# EasyEDA Pro project ProProject_25电赛备赛_2025-07-07.epro, board PCB1_2
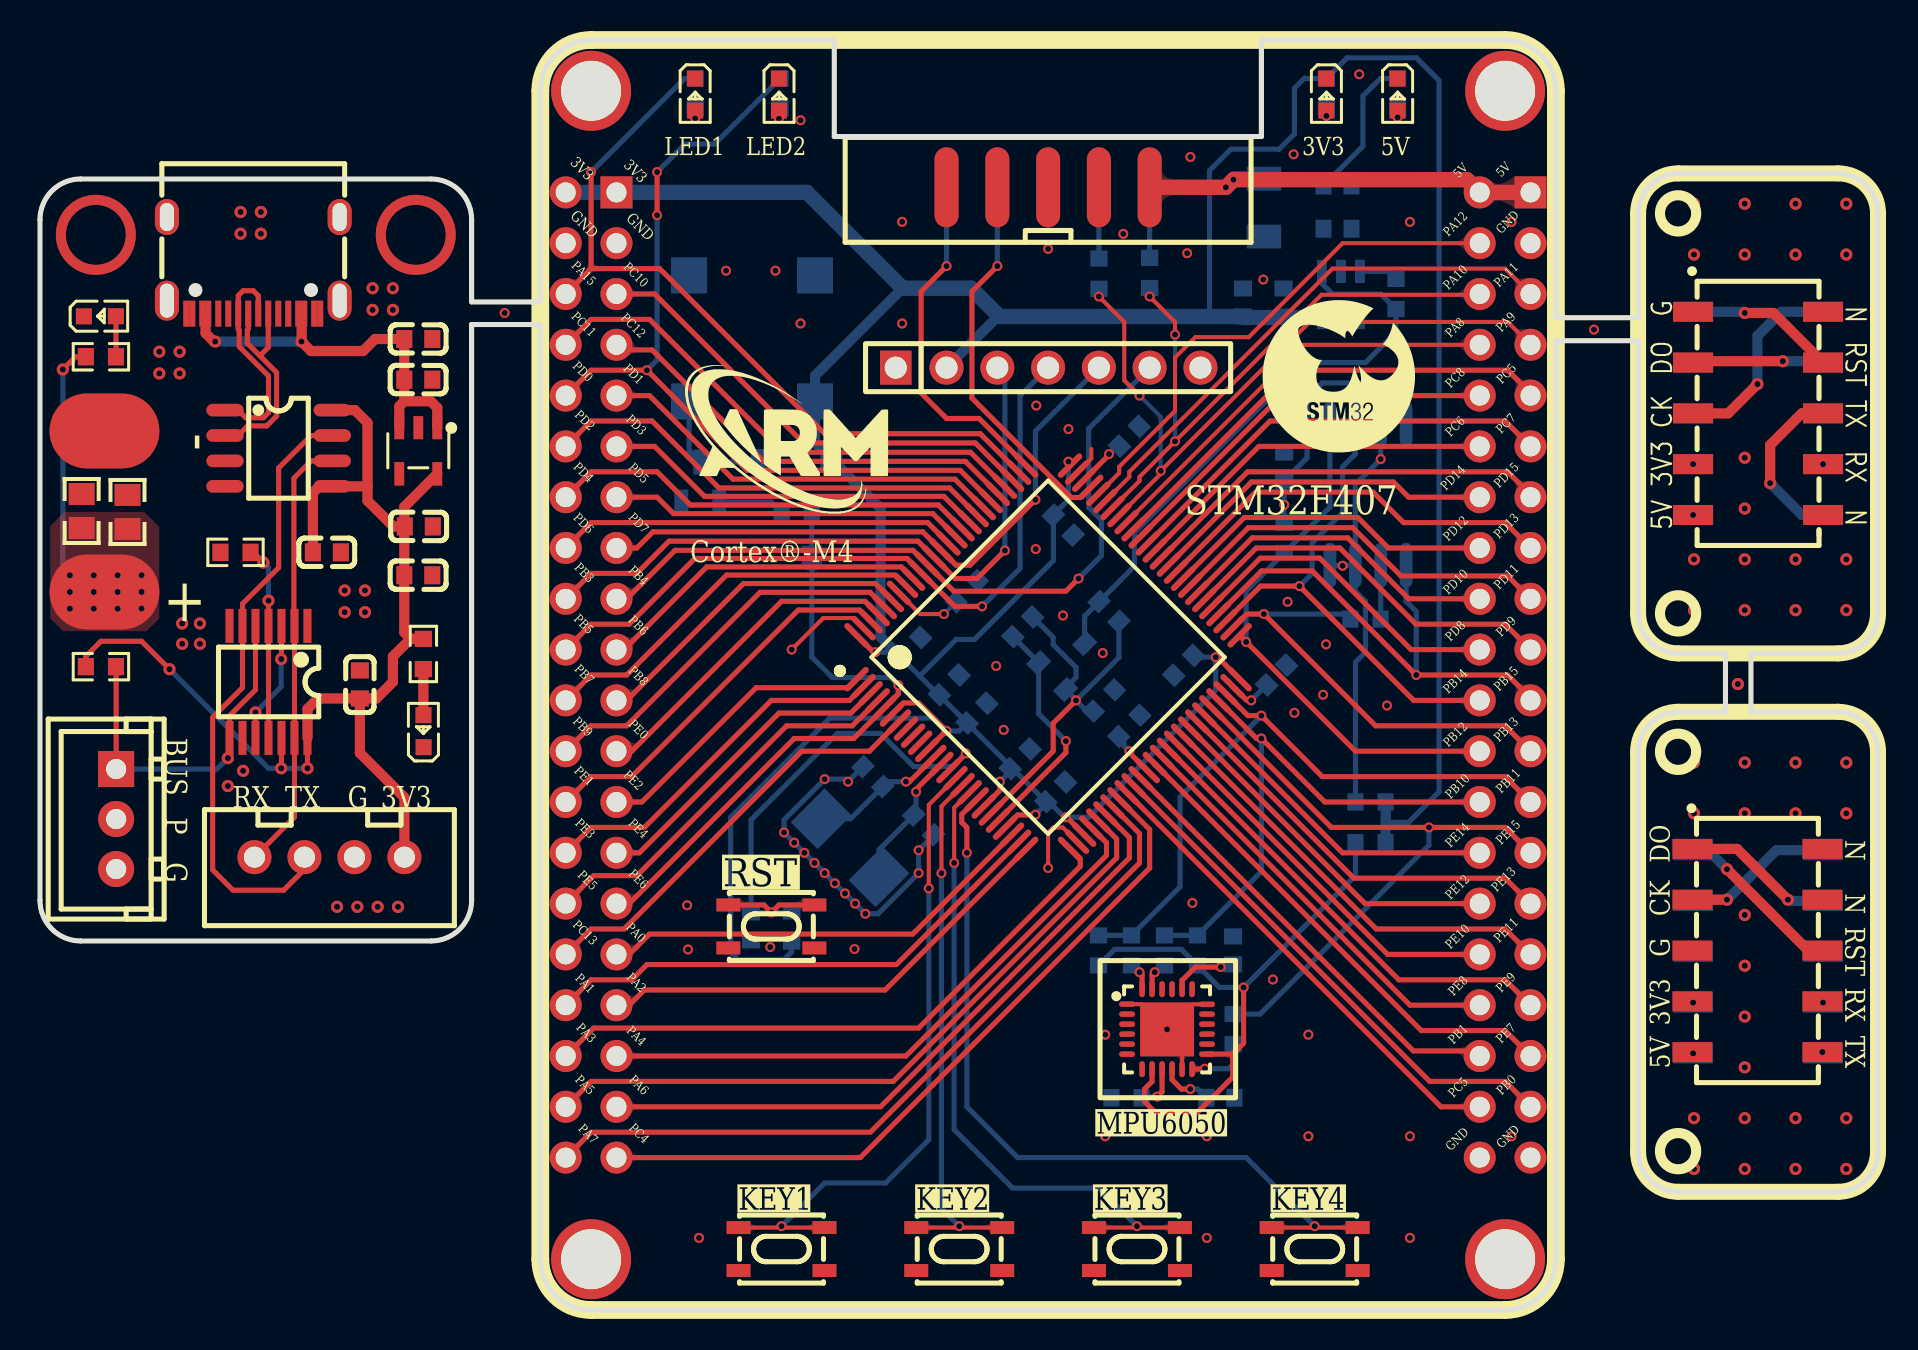
[diagram p6: board, top side]
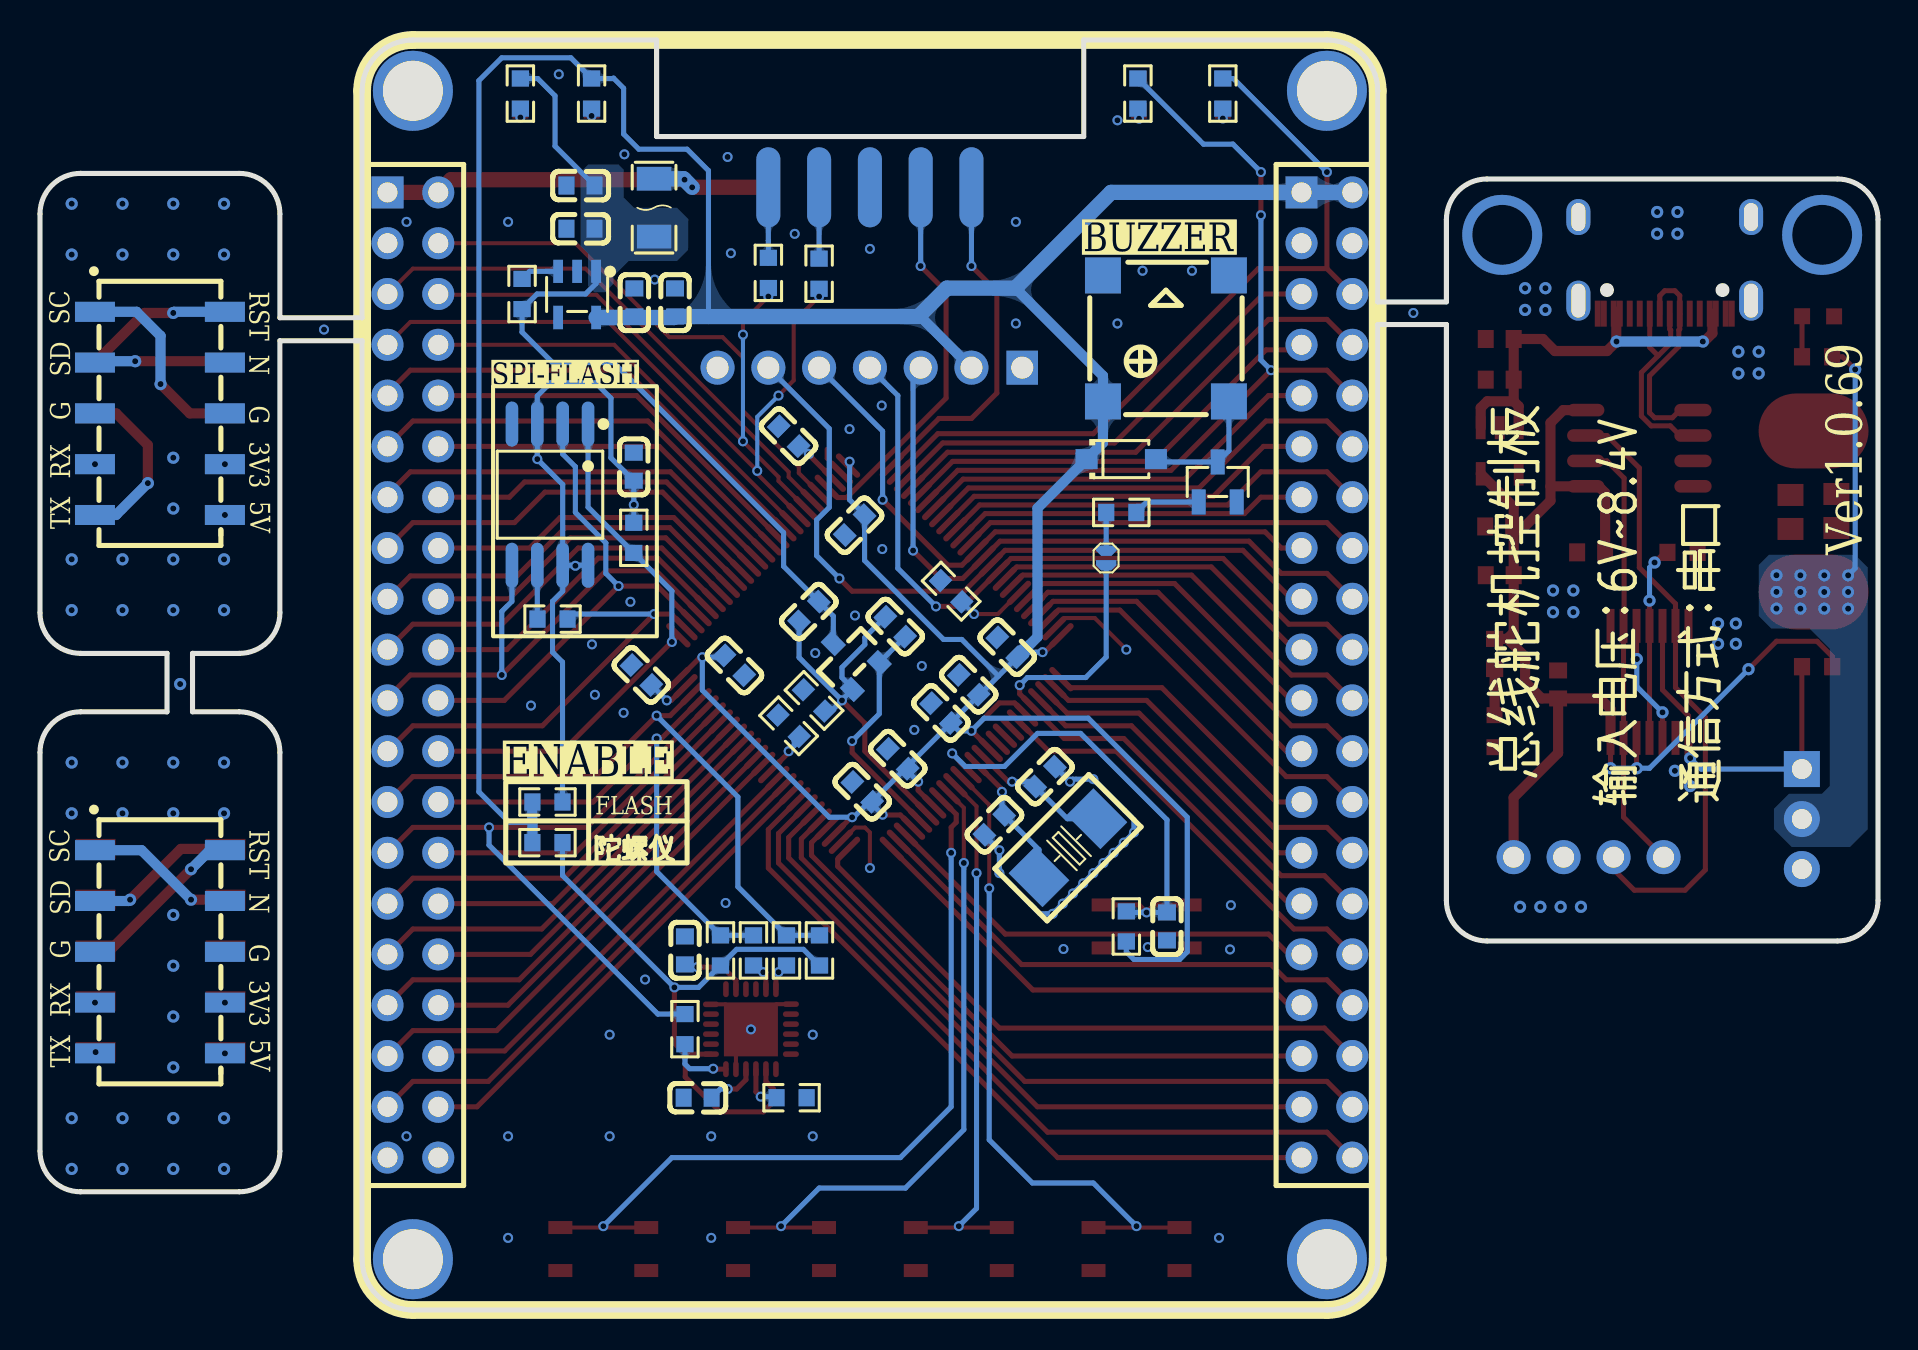
[diagram p7: board, bottom side, seen from below]

Outline 91.94 x 63.5 mm; copper layers: Top Layer, Bottom Layer. Coordinates in mm from the lower left corner of the outline.
Outline path: 0,54.52 0,20.48 arc(0.6,19.05) 2.03,18.45 19.56,18.45 arc(20.99,19.05) 21.59,20.48 21.59,49.27 25.03,49.27 25.03,2.54 arc(25.77,0.74) 27.57,0 73.29,0 arc(75.08,0.74) 75.83,2.54 75.83,48.46 79.94,48.46 79.94,34.86 arc(80.53,33.43) 81.97,32.83 84.31,32.83 84.31,29.91 81.97,29.91 arc(80.53,29.31) 79.94,27.88 79.94,7.94 arc(80.53,6.51) 81.97,5.91 89.91,5.91 arc(91.34,6.51) 91.94,7.94 91.94,27.88 arc(91.34,29.31) 89.91,29.91 85.58,29.91 85.58,32.83 89.91,32.83 arc(91.34,33.43) 91.94,34.86 91.94,54.8 arc(91.34,56.24) 89.91,56.83 81.97,56.83 arc(80.53,56.24) 79.94,54.8 79.94,49.61 75.83,49.61 75.83,60.96 arc(75.08,62.76) 73.29,63.5 61.09,63.5 61.09,58.67 39.73,58.67 39.73,63.5 27.57,63.5 arc(25.77,62.76) 25.03,60.96 25.03,50.4 21.59,50.4 21.59,54.52 arc(20.99,55.96) 19.56,56.55 2.03,56.55 arc(0.6,55.96) 0,54.52
Stack: Top Layer 0.035mm - / Dielectric1 1.51mm FR4 er 4.5 / Bottom Layer 0.035mm -

## Design rules (mm)
net OSC_OUT: DP4
net OSC_IN: DP4
net OSC32_IN: DP3
net OSC32_OUT: DP3
template: 自定义配置
spacing copperThickness1oz (default): track to track 0.102, other pairs 0.152 to 0.3
spacing copperThickness2oz: track to track 0.203, other pairs 0.152 to 0.3
track width copperThickness1oz (default): min 0.127, default 0.254, max 2.54
track width copperThickness2oz: min 0.203, default 0.254, max 2.54
differential pair differentialPair (default): width min 0.127, default 0.254, max 2.54; gap min 0.152, default 0.152
via viaSize (default): diameter min 0.399, default 0.5, max 10; hole min 0.3, default 0.3, max 6.299

## Placement (name value [footprint] x y rotation side)
BUZZER1  SMD-7525  [BUZ-SMD_4P-L7.5-W7.5-BR]  35.62 48.58 270 bottom
C17  100nF  [C0603]  62.24 42.16 90 bottom
C19  -  [capc2012[0805]s-n]  4.38 39.9 270 top
C19#2  -  [C0603]  64.9 56.22 0 bottom
C20  -  [capc2012[0805]s-n]  2.08 39.95 270 top
C20#2  -  [C0603]  64.9 54.06 0 bottom
C21  1uF  [C0603]  62.21 50.38 90 bottom
C22  10nF  [C0603]  60.17 50.38 90 bottom
C25  100nF  [C0603]  18.92 46.52 0 top
C26  1uF  [C0603]  18.95 39.18 0 top
C43  100nF  [C0603]  16 31.28 90 top
C44  100nF  [C0603]  14.35 37.88 0 top
C45  1uF  [C0603]  18.92 48.55 0 top
C46  100nF  [C0603]  18.92 36.74 0 top
CN1  XH2.54-3A  [CONN-TH_3P-P2.50_HCTL_XH-3A-L]  3.81 24.55 90 top
D2  1N4148W  [SOD-123F_L2.7-W1.6-LS3.8-RD]  37.85 42.55 180 bottom
H1  -  [HDR-TH_7P-P2.54-V-F]  50.43 47.12 0 top
LED1  -  [LED_0603]  19.18 28.99 90 top
LED2  -  [LED_0603]  3.05 49.69 0 top
LED2#2  -  [LED_0603]  64.35 60.72 270 top
LED5  -  [LED_0603]  67.91 60.72 270 top
LED8  -  [LED_0603]  32.77 60.72 270 top
LED9  -  [LED_0603]  36.97 60.72 270 top
NOREF  -  [Pad_e112]  73.29 60.96 0 top
NOREF#2  -  [Pad_e923]  27.57 60.96 0 top
NOREF#3  -  [Pad_e925]  73.29 2.54 0 top
NOREF#4  -  [Pad_e924]  27.57 2.54 0 top
P1  2.54-2*5P简牛  [简牛2*5-2.54]  50.43 56.13 0 top
P5  WirePad  [WirePad-4x6]  3.22 43.95 180 top
P6  WirePad  [WirePad-4x6]  3.22 35.9 180 top
Q3  SS8050  [SOT-23-3_L2.9-W1.3-P1.90-LS2.4-BR]  33.03 41.4 270 bottom
R1  10K  [R0603]  3.05 32.17 0 top
R2  10K  [R0603]  9.78 37.88 180 top
R3  -  [R0603]  19.18 32.8 270 top
R3#2  -  [R0603]  37.6 19.18 270 bottom
R4  -  [R0603]  3.05 47.66 0 top
R4#2  -  [R0603]  52.97 51.82 90 bottom
R5  20Ω  [R0603]  55.5 51.85 90 bottom
R8  180  [R0603]  37.85 39.88 180 bottom
R12  10K  [R0603]  67.83 50.8 270 bottom
R16  10K  [R0603]  46.36 35.94 45 bottom
R17  0  [R0603]  53.22 30.48 45 bottom
R22  10K  [R0603]  54.49 29.21 45 bottom
R27  10K  [R0603]  52.95 17.98 270 bottom
R28  10K  [R0603]  57.9 17.98 270 bottom
R29  120R  [R0603]  54.6 17.98 90 bottom
R30  120R  [R0603]  56.25 17.98 90 bottom
R31  120R  [R0603]  59.68 14.04 270 bottom
R32  10K  [R0603]  54.35 10.61 0 bottom
R44  22  [R0603]  66.3 34.54 0 bottom
R45  10K  [R0603]  62.24 38.61 90 bottom
R47  10kΩ  [R0603]  64.35 60.82 90 bottom
R50  10kΩ  [R0603]  67.91 60.82 90 bottom
R53  10kΩ  [R0603]  32.77 60.82 90 bottom
R54  10kΩ  [R0603]  37.02 60.82 90 bottom
R56  0  [R0603]  66.55 23.37 0 bottom
R57  0  [R0603]  66.55 25.4 0 bottom
RST  YTS-A016-2  [SW-SMD_4P-L4.2-W3.3-P2.15-LS4.7]  36.58 19.18 0 top
SW3  YTS-A016-2  [SW-SMD_4P-L4.2-W3.3-P2.15-LS4.7]  37.09 3.05 0 top
SW4  YTS-A016-2  [SW-SMD_4P-L4.2-W3.3-P2.15-LS4.7]  45.98 3.05 0 top
SW5  YTS-A016-2  [SW-SMD_4P-L4.2-W3.3-P2.15-LS4.7]  54.87 3.05 180 top
SW6  YTS-A016-2  [SW-SMD_4P-L4.2-W3.3-P2.15-LS4.7]  63.76 3.05 180 top
U1  -  [LQFP-100_L14.0-W14.0-P0.50-LS16.0-BL]  50.43 32.64 315 top
U1#2  -  [HDR-SMD_10P-L13.1-W6.0-P2.54-LS7.1-EH]  85.94 17.91 270 bottom
U2  -  [HDR-SMD_10P-L13.1-W6.0-P2.54-LS7.1-EH]  85.91 17.97 270 top
U2#2  -  [C0603]  41.66 26.67 135 bottom
U3  -  [SOT-23-5_L3.0-W1.7-P0.95-LS2.8-BL]  18.92 42.96 180 top
U3#2  -  [HDR-SMD_10P-L13.1-W6.0-P2.54-LS7.1-EH]  85.94 44.83 270 bottom
U3#3  -  [C0603]  44.2 24.26 315 bottom
U4  -  [HDR-SMD_10P-L13.1-W6.0-P2.54-LS7.1-EH]  85.94 44.83 270 top
U4#2  -  [SOT-23_L2.9-W1.3-P1.90-LS2.4-BR]  51.44 32.51 225 bottom
U5  -  [TSSOP-14_L5.0-W4.4-P0.65-LS6.4-BL]  11.43 31.41 180 top
U5#2  -  [C0603]  49.16 34.16 225 bottom
U6  -  [CONN-TH_4P-P2.50-XH2.54-4P]  14.48 22.64 0 top
U6#2  -  [C0603]  53.47 34.92 135 bottom
U7  1uF  [C0603]  61.86 31.75 225 bottom
U8  -  [SOP-8_L4.9-W3.9-P1.27-LS6.0-BL]  11.94 43.09 270 top
U8#2  -  [C0603]  54.49 43.69 225 bottom
U9  100nF  [C0603]  35.57 19.18 90 bottom
U16  100nF  [C0603]  49.03 27.56 225 bottom
U17  100nF  [C0603]  46.87 29.84 225 bottom
U18  100nF  [C0603]  45.48 31.26 225 bottom
U19  100nF  [C0603]  43.55 33.13 225 bottom
U20  100nF  [C0603]  51.19 39.24 135 bottom
U29  100nF  [C0603]  50.81 25.91 225 bottom
U30  100nF  [C0603]  57.2 32.23 45 bottom
U31  1.5A快恢复保险丝-1206  [F1206]  61.22 55.12 270 bottom
U32  MPU-6050  [QFN-24_L4.0-W4.0-P0.50-BL-EP2.7]  56.38 14.04 270 top
U33  100nF  [C0603]  59.04 10.61 0 bottom
U34  100nF  [C0603]  59.68 17.98 270 bottom
U36  -  [短接焊盘]  38.61 37.59 90 bottom
U37  W25Q128JVSIQ  [SOIC-8_L5.3-W5.3-P1.27-LS8.0-BL]  66.43 40.77 0 bottom
U38  2.54-2*20  [HDR-TH_40P-P2.54-V-F-R2-C20-S2.54]  73.29 31.75 270 bottom
U39  2.54-2*20  [HDR-TH_40P-P2.54-V-F-R2-C20-S2.54]  27.57 31.75 270 bottom
U40  RT9013-33GB  [SOT-23-5_L3.0-W1.7-P0.95-LS2.8-BL]  65.07 50.78 0 bottom
USB1  -  [USB_TYPE-C-16P]  10.8 52.23 180 top
X1  8MHz  [OSC-SMD_L5.0-W3.2]  40.52 23.11 135 bottom

## Footprints (pads in the part's own frame, mm; a bottom-side part is the same pattern mirrored in y, then rotated)
BUZ-SMD_4P-L7.5-W7.5-BR
  rect 1.8x1.8 smd: 1(3.15,-3.15) 2(3.15,3.15) 3(-3.15,3.15) 4(-3.15,-3.15)
C0603
  rect 0.8x0.9 smd: 1(-0.7,0) 2(0.7,0)
capc2012[0805]s-n
  rect 1.1x1.3 smd: 1(-0.85,0) 2(0.85,0)
CONN-TH_3P-P2.50_HCTL_XH-3A-L
  rect 1.8x1.8 hole 1: 1(2.5,0)
  round 1.8 hole 1: 2(0,0) 3(-2.5,0)
CONN-TH_4P-P2.50-XH2.54-4P
  round 1.7 hole 1.05: 1(3.75,0) 2(1.25,0) 3(-1.25,0) 4(-3.75,0)
F1206
  rect 1.19x1.728 smd: 1(-1.445,0) 2(1.445,0)
HDR-SMD_10P-L13.1-W6.0-P2.54-LS7.1-EH
  rect 1x2 smd: 1(-5.08,-3.25) 2(-2.54,-3.25) 3(0,-3.25) 4(2.54,-3.25) 5(5.08,-3.25) 6(5.08,3.25) 7(2.54,3.25) 8(0,3.25) 9(-2.54,3.25) 10(-5.08,3.25)
HDR-TH_7P-P2.54-V-F
  rect 1.575x1.7 hole 1.1: 1(-7.62,0)
  round 1.7 hole 1.1: 2(-5.08,0) 3(-2.54,0) 4(0,0) 5(2.54,0) 6(5.08,0) 7(7.62,0)
HDR-TH_40P-P2.54-V-F-R2-C20-S2.54
  rect 1.6x1.6 hole 1: 1(-24.13,-1.27)
  round 1.6 hole 1: 2(-24.13,1.27) 3(-21.59,-1.27) 4(-21.59,1.27) 5(-19.05,-1.27) 6(-19.05,1.27) 7(-16.51,-1.27) 8(-16.51,1.27) 9(-13.97,-1.27) 10(-13.97,1.27) 11(-11.43,-1.27) 12(-11.43,1.27) 13(-8.89,-1.27) 14(-8.89,1.27) 15(-6.35,-1.27) 16(-6.35,1.27) 17(-3.81,-1.27) 18(-3.81,1.27) 19(-1.27,-1.27) 20(-1.27,1.27) 21(1.27,-1.27) 22(1.27,1.27) 23(3.81,-1.27) 24(3.81,1.27) 25(6.35,-1.27) 26(6.35,1.27) 27(8.89,-1.27) 28(8.89,1.27) 29(11.43,-1.27) 30(11.43,1.27) 31(13.97,-1.27) 32(13.97,1.27) 33(16.51,-1.27) 34(16.51,1.27) 35(19.05,-1.27) 36(19.05,1.27) 37(21.59,-1.27) 38(21.59,1.27) 39(24.13,-1.27) 40(24.13,1.27)
LED_0603
  rect 0.8x0.8 smd: 1(-0.851,-0.01) 2(0.75,-0.005)
LQFP-100_L14.0-W14.0-P0.50-LS16.0-BL
  oval 0.3x1.6 smd: 1(-6,-7.55) 2(-5.5,-7.55) 3(-5,-7.55) 4(-4.5,-7.55) 5(-4,-7.55) 6(-3.5,-7.55) 7(-3,-7.55) 8(-2.5,-7.55) 9(-2,-7.55) 10(-1.5,-7.55) 11(-1,-7.55) 12(-0.5,-7.55) 13(0,-7.55) 14(0.5,-7.55) 15(1,-7.55) 16(1.5,-7.55) 17(2,-7.55) 18(2.5,-7.55) 19(3,-7.55) 20(3.5,-7.55) 21(4,-7.55) 22(4.5,-7.55) 23(5,-7.55) 24(5.5,-7.55) 25(6,-7.55) 51(6,7.55) 52(5.5,7.55) 53(5,7.55) 54(4.5,7.55) 55(4,7.55) 56(3.5,7.55) 57(3,7.55) 58(2.5,7.55) 59(2,7.55) 60(1.5,7.55) 61(1,7.55) 62(0.5,7.55) 63(0,7.55) 64(-0.5,7.55) 65(-1,7.55) 66(-1.5,7.55) 67(-2,7.55) 68(-2.5,7.55) 69(-3,7.55) 70(-3.5,7.55) 71(-4,7.55) 72(-4.5,7.55) 73(-5,7.55) 74(-5.5,7.55) 75(-6,7.55)
  oval 1.6x0.3 smd: 26(7.55,-6) 27(7.55,-5.5) 28(7.55,-5) 29(7.55,-4.5) 30(7.55,-4) 31(7.55,-3.5) 32(7.55,-3) 33(7.55,-2.5) 34(7.55,-2) 35(7.55,-1.5) 36(7.55,-1) 37(7.55,-0.5) 38(7.55,0) 39(7.55,0.5) 40(7.55,1) 41(7.55,1.5) 42(7.55,2) 43(7.55,2.5) 44(7.55,3) 45(7.55,3.5) 46(7.55,4) 47(7.55,4.5) 48(7.55,5) 49(7.55,5.5) 50(7.55,6) 76(-7.55,6) 77(-7.55,5.5) 78(-7.55,5) 79(-7.55,4.5) 80(-7.55,4) 81(-7.55,3.5) 82(-7.55,3) 83(-7.55,2.5) 84(-7.55,2) 85(-7.55,1.5) 86(-7.55,1) 87(-7.55,0.5) 88(-7.55,0) 89(-7.55,-0.5) 90(-7.55,-1) 91(-7.55,-1.5) 92(-7.55,-2) 93(-7.55,-2.5) 94(-7.55,-3) 95(-7.55,-3.5) 96(-7.55,-4) 97(-7.55,-4.5) 98(-7.55,-5) 99(-7.55,-5.5) 100(-7.55,-6)
OSC-SMD_L5.0-W3.2
  rect 1.9x2.4 smd: 1(-2.05,0) 2(2.05,0)
Pad_e112
  round 4 hole 3: 0(0,0)
Pad_e923
  round 4 hole 3: 0(0,0)
Pad_e924
  round 4 hole 3: 0(0,0)
Pad_e925
  round 4 hole 3: 0(0,0)
QFN-24_L4.0-W4.0-P0.50-BL-EP2.7
  oval 0.28x0.8 smd: 1(-1.25,-2) 2(-0.75,-2) 3(-0.25,-2) 4(0.25,-2) 5(0.75,-2) 6(1.25,-2) 13(1.25,2) 14(0.75,2) 15(0.25,2) 16(-0.25,2) 17(-0.75,2) 18(-1.242,2)
  oval 0.8x0.28 smd: 7(2,-1.25) 8(2,-0.75) 9(2,-0.25) 10(2,0.25) 11(2,0.75) 12(2,1.25) 19(-2,1.25) 20(-2,0.75) 21(-2,0.25) 22(-2,-0.25) 23(-2,-0.75) 24(-2,-1.25)
  rect 2.7x2.7 smd: 25(0.013,0)
R0603
  rect 0.806x0.864 smd: 1(-0.753,0) 2(0.753,0)
SOD-123F_L2.7-W1.6-LS3.8-RD
  rect 1.1x1 smd: 1(-1.735,0) 2(1.735,0)
SOIC-8_L5.3-W5.3-P1.27-LS8.0-BL
  oval 0.63x2.25 smd: 1(-1.905,-3.53) 2(-0.635,-3.53) 3(0.635,-3.53) 4(1.905,-3.53) 5(1.905,3.53) 6(0.635,3.53) 7(-0.635,3.53) 8(-1.905,3.53)
SOP-8_L4.9-W3.9-P1.27-LS6.0-BL
  oval 0.63x1.865 smd: 1(-1.905,-2.683) 2(-0.635,-2.683) 3(0.635,-2.683) 4(1.905,-2.683) 5(1.905,2.683) 6(0.635,2.683) 7(-0.635,2.683) 8(-1.905,2.683)
SOT-23-3_L2.9-W1.3-P1.90-LS2.4-BR
  rect 1.25x0.7 smd: 1(1,-0.95) 2(1,0.95) 3(-1,0)
SOT-23-5_L3.0-W1.7-P0.95-LS2.8-BL
  rect 0.49x1.157 smd: 1(-0.95,-1.153) 2(0,-1.153) 3(0.95,-1.153)
  rect 0.49x1.175 smd: 4(0.95,1.153) 5(-0.95,1.153)
SOT-23_L2.9-W1.3-P1.90-LS2.4-BR
  rect 1x0.8 smd: 1(1.15,-0.95) 2(1.15,0.95) 3(-1.15,0)
SW-SMD_4P-L4.2-W3.3-P2.15-LS4.7
  rect 1.2x0.65 smd: 1(-2.15,1.075) 2(2.15,1.075) 3(-2.15,-1.075) 4(2.15,-1.075)
TSSOP-14_L5.0-W4.4-P0.65-LS6.4-BL
  rect 0.4x1.7 smd: 1(-1.95,-2.8) 2(-1.3,-2.8) 3(-0.65,-2.8) 4(0,-2.8) 5(0.65,-2.8) 6(1.3,-2.8) 7(1.95,-2.8) 8(1.95,2.8) 9(1.3,2.8) 10(0.65,2.8) 11(0,2.8) 12(-0.65,2.8) 13(-1.3,2.8) 14(-1.95,2.8)
USB_TYPE-C-16P
  oval 1.2x2 hole 0.7x1.7: 1(-4.193,1.765) 2(4.447,1.765)
  oval 1.2x1.8 hole 0.7x1.4: 3(-4.193,-2.415) 4(4.447,-2.415)
  rect 0.3x1.3 smd: A1(-3.223,2.415) A4(-2.423,2.415) A5(-1.123,2.415) A6(-0.123,2.415) A7(0.377,2.415) A8(1.377,2.415) A9(2.677,2.415) A12(3.477,2.415) B1(3.177,2.415) B4(2.377,2.415) B5(1.877,2.415) B6(0.877,2.415) B7(-0.623,2.415) B8(-1.623,2.415) B9(-2.123,2.415) B12(-2.923,2.415)
WirePad-4x6
  rrect 5.5x3.75 smd: 1(0,0)
短接焊盘
  custom 0.508x1.016 smd: 1(-0.353,-0.008) 2(0.368,-0.015)
简牛2*5-2.54
  oval 1.2x4 smd: 1(-5.08,0) 3(-2.54,0) 5(0,0) 7(2.54,0) 9(5.08,0)
  oval 1.2x4 smd far side: 2(-5.08,0) 4(-2.54,0) 6(0,0) 8(2.54,0) 10(5.08,0)

## Nets
3V3: BUZZER1.1 C21.1 C22.1 C26.1 C43.1 C44.1 C46.1 D2.1 H1.2 R1.1 R3.1 R3#2.2 R47.2 R56.2 R57.2 U1.6 U1.11 U1.19 U1.22 U1.28 U1.50 U1.75 U1.100 U1#2.7 U2.4 U3.5 U5.12 U5.14 U6.1 U8.5 U8.8 U16.2 U17.2 U18.2 U19.2 U20.2 U29.2 U30.2 U39.1 U39.2 U40.5
3V31: U3#2.7 U4.4
5V: C19#2.1 C20#2.1 R12.2 R50.2 U4#2.3 U6#2.2 U31.2 U40.1
AGND: R17.1 U1.20 U4#2.1 U5#2.1 U6#2.1
GND: C17.2 C19.1 C19#2.2 C20.1 C20#2.2 C21.2 C22.2 C25.2 C26.2 C43.2 C44.2 C45.2 C46.2 CN1.3 H1.1 LED1.1 LED2.1 LED2#2.1 LED5.1 LED8.1 LED9.1 P1.5 P1.6 P5.1 Q3.2 R2.2 R16.2 R17.2 R22.2 R32.1 RST.3 RST.4 SW3.3 SW3.4 SW4.3 SW4.4 SW5.1 SW5.2 SW6.1 SW6.2 U1.10 U1.27 U1.74 U1.99 U1#2.3 U1#2.8 U2.3 U2#2.2 U3.2 U3#2.3 U3#2.8 U3#3.2 U4.1 U5.1 U5.7 U5.9 U6.2 U7.1 U8.3 U8#2.1 U9.1 U16.1 U17.1 U18.1 U19.1 U20.1 U29.1 U30.1 U32.1 U32.11 U32.18 U32.25 U33.2 U34.1 U37.4 U38.3 U38.39 U38.40 U39.3 U39.4 U40.2 USB1.1 USB1.2 USB1.3 USB1.4 USB1.A1 USB1.A12 USB1.B1 USB1.B12
PVCC: C19.2 C20.2 CN1.2 P6.1 R4.1
VBUS: C25.1 C45.1 U3.1 U3.3 USB1.A4 USB1.A9 USB1.B4 USB1.B9
VIN: P1.9 U1#2.6 U2.5 U31.1 U38.1 U38.2
VIN1: U3#2.6 U4.5
BOOT0: R16.1 U1.94
BOOT1: R22.1 U1.37
BUS: CN1.1 R1.2 U5.5 U5.8
BUZZER: R8.1 U36.2
FLASH_VCC: C17.1 R45.2 R57.1 U37.3 U37.7 U37.8
KEY1: SW3.1 SW3.2 U1.15
KEY2: SW4.1 SW4.2 U1.16
KEY3: SW5.3 SW5.4 U1.17
KEY4: SW6.3 SW6.4 U1.18
LCD_DC: H1.6 U1.90 U39.17
LCD_RES: H1.5 U1.88 U39.15
LCD_SCL: H1.3 U1.89 U39.18
LCD_SDA: H1.4 U1.91 U39.20
LED1: R54.2 U1.81 U39.10
LED2: R53.2 U1.77 U39.6
MPU_INT: R31.1 U1.46 U38.27
MPU_SCL: R28.1 R30.2 U1.47 U38.26
MPU_SDA: R27.1 R29.2 U1.48 U38.25
MPU_VCC: R27.2 R28.2 R56.1 U32.8 U32.13
NRST: R3#2.1 RST.1 RST.2 U1.14 U1#2.10 U2.8 U9.2
NRST1: U3#2.10 U4.9
OSC32_IN: U1.8
OSC32_OUT: U1.9
OSC_IN: U1.12 U2#2.1 X1.2
OSC_OUT: U1.13 U3#3.1 X1.1
PA0: U1.23 U39.31
PA1: U1.24 U39.34
PA2: U1.25 U39.33
PA3: U1.26 U39.36
PA4: U1.29 U39.35
PA5: U1.30 U39.38
PA6: U1.31 U39.37
PA7: U1.32 U39.40
PA8: U1.67 U38.8
PA9: R4#2.1 U1.68 U38.7
PA10: R5.1 U1.69 U38.6
PA11: U1.70 U38.5
PA12: U1.71 U38.4
PA13: P1.4 U1.72
PA14: P1.2 U1.76
PB0: U1.35 U38.37
PB1: U1.36 U38.36
PB6: U1.92 U39.19
PB7: U1.93 U39.22
PB8: U1.95 U39.21
PB9: U1.96 U39.24
PB12: R45.1 U1.51 U37.1 U38.24
PB13: R44.1 U1.52 U38.23
PB14: U1.53 U37.2 U38.22
PB15: U1.54 U37.5 U38.21
PC4: U1.33 U39.39
PC5: U1.34 U38.38
PC6: U1.63 U38.12
PC7: U1.64 U38.11
PC8: U1.65 U38.10
PC9: U1.66 U38.9
PC10: U1.78 U39.5
PC11: U1.79 U39.8
PC12: U1.80 U39.7
PC13: U1.7 U39.32
PD1: U1.82 U39.9
PD2: U1.83 U39.12
PD3: U1.84 U39.11
PD4: U1.85 U39.14
PD5: U1.86 U39.13
PD6: U1.87 U39.16
PD8: U1.55 U38.20
PD9: U1.56 U38.19
PD10: U1.57 U38.18
PD11: U1.58 U38.17
PD12: U1.59 U38.16
PD13: U1.60 U38.15
PD14: U1.61 U38.14
PD15: U1.62 U38.13
PE0: U1.97 U39.23
PE1: U1.98 U39.26
PE2: U1.1 U39.25
PE3: U1.2 U39.28
PE4: U1.3 U39.27
PE5: U1.4 U39.30
PE6: U1.5 U36.1 U39.29
PE7: U1.38 U38.35
PE8: U1.39 U38.34
PE9: U1.40 U38.33
PE10: U1.41 U38.32
PE11: U1.42 U38.31
PE12: U1.43 U38.30
PE13: U1.44 U38.29
PE14: U1.45 U38.28
RX: U1#2.4 U2.7
RX1: U3#2.4 U4.7
S_RX: U5.2 U5.13 U6.4 U8.6
S_TX: U5.6 U6.3 U8.7
SWCLK: U1#2.1 U2.2
SWCLK1: U3#2.1 U4.3
SWDIO: U1#2.2 U2.1
SWDIO1: U3#2.2 U4.2
TX: U1#2.5 U2.6
TX1: U3#2.5 U4.8
USB_DN: U8.2 USB1.A7 USB1.B7
USB_DP: U8.1 USB1.A6 USB1.B6
$1N348: U5.3 U5.10
$1N351: R2.1 U5.4 U5.11
$1N1470: LED1.2 R3.2
$1N1496: LED2.2 R4.2
$1N1608: U1.21 U4#2.2 U5#2.2
$1N1611: U1.49 U7.2
$1N1612: U1.73 U8#2.2
$1N2522: P1.8 R4#2.2
$1N2523: P1.10 R5.2
$1N6488: R29.1 U32.24
$1N6489: R30.1 U32.23
$1N6494: R31.2 U32.12
$1N6499: R32.2 U32.9
$1N6502: U32.10 U33.1
$1N6503: U32.20 U34.2
$1N11456: R44.2 U37.6
$1N14653: BUZZER1.2 D2.2 Q3.3
$1N14654: Q3.1 R8.2
$1N14984: LED2#2.2 R47.1
$1N15262: LED5.2 R50.1
$1N15508: LED8.2 R53.1
$1N19842: LED9.2 R54.1
$1N50866: R12.1 U40.3

Pads without a net: BUZZER1 3 4; H1 7; NOREF 0; NOREF#2 0; NOREF#3 0; NOREF#4 0; P1 1 3 7; U1#2 9; U2 9 10; U3 4; U3#2 9; U4 6 10; U8 4; U32 2 3 4 5 6 7 14 15 16 17 19 21 22; U40 4; USB1 A5 A8 B5 B8

## Via types
v1: diameter 0.5, hole 0.3, Top Layer to Bottom Layer, 107 vias
v2: diameter 4, hole 3, Top Layer to Bottom Layer, 2 vias
v3: diameter 0.61, hole 0.305, Top Layer to Bottom Layer, 102 vias
v4: diameter 0.503, hole 0.299, Top Layer to Bottom Layer, 19 vias

## Routing (per net, layer and track width the routed paths; a pad name or vN(x,y) marks a point on that pad's centre or on a via; arc(x,y) is an arc through that point)
3V3: length 268.7
  Top Layer w0.254: v1(41.79,32.89) 41.69,32.89 40.85,33.73 ; v3(6.48,32.04) 5.08,33.44 3.05,33.44 2.29,32.68 R1.1 ; U1.11 45.33,28.96 v1(45.35,28.96) 43.95,30.35 43.19,30.35 U1.6 ; 60.01,31.54 58.91,32.64 v1(58.81,32.64) ; v1(49.79,24.77) 49.78,24.75 48.9,24.75 U1.22 ; v1(48.01,26.42) 48.01,25.98 U1.19 ; U5.12 12.08,27.1 v3(12.06,27.09) ; U1.28 51.36,24.64 v1(51.32,24.64) ; v3(13.38,27.09) U5.14
  Top Layer w0.508: 18.22,39.18 18.22,40.16 U3.5 ; 18.22,39.18 C46.1 18.22,33.88 18.55,33.56 ; 18.22,39.18 17.67,39.18 16.38,40.47 16.38,41.18 ; 18.22,39.18 C26.1 ; 16.38,41.18 16.38,44.36 15.75,44.99 U8.8 ; 16.38,41.18 U8.5 13.97,41.18 13.65,40.86 C44.1 ; U6.1 18.23,25.62 16,27.85 C43.1 ; 18.55,33.56 18.53,33.56 17.65,32.67 17.65,31.41 16.83,30.58 C43.1 ; 18.55,33.56 R3.1 ; U5.14 13.38,30.05 13.91,30.58 C43.1
  Bottom Layer w0.254: 46.38,29.35 44.98,30.74 U18.2 44.93,30.76 44,31.7 ; 46.38,29.35 45.98,28.96 v1(45.35,28.96) 44.71,29.59 39.5,29.59 34.55,24.64 34.55,17.91 34.93,17.53 37.22,17.53 37.6,17.91 R3#2.2 ; 46.38,29.35 48.66,27.06 ; 48.66,27.06 U16.2 48.66,27.06 ; 48.66,27.06 50.38,25.35 ; 48.66,27.06 v1(48.01,26.42) ; 50.38,25.35 v1(49.79,24.77) ; 50.38,25.35 50.45,25.42 51.24,24.64 v1(51.32,24.64) 52.46,24.64 58.81,30.99 v1(58.81,32.64) 57.79,32.64 U30.2 ; 50.38,25.35 50.44,25.29 ; 43.06,32.64 44,31.7 ; 44,31.7 45.83,33.53 46.74,33.53 50.69,37.48 U20.2 ; v3(13.38,27.09) v3(12.06,27.09) 11.43,27.09 v3(6.48,32.04) ; 50.57,39.64 51.44,40.51 v1(51.44,42.42) ; 42.8,32.89 v1(41.79,32.89) ; 67.32,24.51 67.44,24.38 68.46,24.38 69.98,25.91 69.98,61.47 68.84,62.61 65.38,62.61 R47.2 63.27,61.57 63.25,61.59 62.74,61.09 62.74,58.8 61.98,58.04 59.57,58.04 58.5,56.97 58.5,49.68
  Bottom Layer w0.508: 42.8,32.89 42.04,33.65 42.04,40.09 D2.1 38.77,43.36 BUZZER1.1 38.77,46.71 43.15,51.09 ; R56.2 67.31,24.5 67.32,24.51 67.32,25.39 R57.2 ; H1.2 47.9,49.68 47.99,49.68
  Bottom Layer w0.762: 42.8,32.89 43.06,32.64 ; U40.5 60.22,49.62 C22.1 47.99,49.68 46.58,51.09 43.15,51.09 38.36,55.88 U39.1 U39.2
  vias: v3(82.69,15.37)
3V31:
  vias: v3(82.69,42.29)
5V: length 37.2
  Bottom Layer w0.254: 52.26,33.33 52.26,34.7 54.74,37.19 54.74,38.87 63.25,47.37 66.3,47.37 67.83,48.89 R12.2 67.07,50.8 64.65,50.8 64.12,51.33 U40.1 ; C19#2.1 66.17,58.19 66.17,60.71 67.04,61.57 R50.2
AGND: length 18.9
  Top Layer w0.254: v1(51.82,30.48) 50.68,29.34 50.68,27.94 U1.20
  Bottom Layer w0.254: v1(51.82,30.48) 53.97,32.63 53.97,34.43 ; v1(51.82,30.48) 51.82,30.5 U4#2.1 51.3,31.1 51.82,31.62 51.82,32.13 50.68,33.27 50.68,33.63 U5#2.1 ; v1(51.82,30.48) 52.36,29.95 R17.1
GND: length 30.6
  Top Layer w0.203: v1(37.6,33.02) 39.18,34.6 40.69,34.6 U1.99 ; v1(56.38,14.03) 57.13,13.28 U32.11 ; 51.88,41.87 52.58,42.58 52.58,43.05 ; U32.1 55.11,15.29 ; U32.18 57.63,15.28 ; v1(50.43,22.1) 50.43,23.88 50.67,24.12 51.16,24.12 U1.27
  Bottom Layer w0.254: U2#2.2 v1(40.42,26.42) 40.29,26.54 v1(39.25,26.54) 37.22,24.51 v1(37.22,23.88) v1(37.73,23.37) v1(38.23,22.86) v1(38.74,22.35) v1(39.25,21.84) v1(39.76,21.34) v1(40.27,20.83) v1(40.77,20.32) v1(41.28,19.81) 41.92,19.81 v1(43.95,21.84) v1(43.95,22.99) 44.7,23.74 U3#3.2
  vias: v1(32.37,20.24) v1(32.41,18.03) v1(36.53,18.15) v1(40.74,18.05) v1(47.83,32.2) v1(49.83,45.22) v1(49.81,38.05) v1(50.43,53.06) v1(51.17,34.72) v1(51.45,44.05) v1(53.16,32.85) v1(54.19,53.81) v1(57.38,52.84) v1(57.54,57.65) v1(57.64,20.35) v1(61.19,51.52) v1(61.67,16.52) v1(62.41,35.41) v1(62.71,57.78) v1(62.75,29.86) v1(64.18,30.76) v1(64.33,33.28) v1(65.99,61.79) v1(67.38,30.22) v3(5.97,47.92) v3(5.97,46.83) v3(6.98,47.92) v3(6.98,46.83) v3(7.11,34.33) v3(7.11,33.31) v3(8,34.33) v3(8,33.31) v3(9.4,26.2) v3(10.03,54.9) v3(10.03,53.81) v3(10.16,26.96) v3(11.05,54.9) v3(11.05,53.81) v3(14.86,20.16) v3(15.24,35.98) v3(15.24,34.89) v3(15.88,20.16) v3(16.26,35.98) v3(16.26,34.89) v3(16.64,51.09) v3(16.64,50) v3(16.89,20.16) v3(17.65,51.09) v3(17.65,50) v3(17.91,20.16) v3(82.73,55.31) v3(82.73,52.77) v3(82.73,37.53) v3(82.73,34.99) v3(82.73,27.37) v3(82.73,24.83) v3(82.73,9.59) v3(82.73,7.05) v3(84.93,31.3) v3(85.27,55.31) v3(85.27,52.77) v3(85.27,42.61) v3(85.27,40.07) v3(85.27,37.53) v3(85.27,34.99) v3(85.27,27.37) v3(85.27,24.83) v3(85.27,19.75) v3(85.27,17.21) v3(85.27,14.67) v3(85.27,12.13) v3(85.27,9.59) v3(85.27,7.05) v3(87.81,55.31) v3(87.81,52.77) v3(87.81,37.53) v3(87.81,34.99) v3(87.81,27.37) v3(87.81,24.83) v3(87.81,9.59) v3(87.81,7.05) v3(90.35,55.31) v3(90.35,52.77) v3(90.35,37.53) v3(90.35,34.99) v3(90.35,27.37) v3(90.35,24.83) v3(90.35,9.59) v3(90.35,7.05) v4(32.96,3.61) v4(34.32,51.96) v4(36.79,51.96) v4(38.04,59.49) v4(38.04,49.33) v4(43.12,54.41) v4(43.12,49.33) v4(48.2,29.01) v4(53.28,13.77) v4(53.28,8.69) v4(58.36,8.69) v4(58.36,3.61) v4(63.44,13.77) v4(63.44,8.69) v4(68.52,54.41) v4(68.52,8.69) v4(68.52,3.61) v4(73.6,54.41) v4(73.6,8.69)
PVCC: length 11.9
  Top Layer w0.254: v3(1.14,47.03) 1.78,47.66 R4.1
  Bottom Layer w0.254: v3(1.14,47.03) 1.14,37.09 v3(1.49,36.73)
  vias: v3(1.49,35.9) v3(1.49,35.07) v3(2.69,36.73) v3(2.69,35.9) v3(2.69,35.07) v3(3.88,36.73) v3(3.88,35.9) v3(3.88,35.07) v3(5.08,36.74) v3(5.08,35.91) v3(5.08,35.07)
VBUS: length 20.3
  Top Layer w0.508: v3(8.76,48.42) 8.7,48.42 8.28,48.84 8.28,49.82 ; 18.22,45.44 C25.1 C45.1 16.76,48.55 16.16,47.95 13.56,47.95 13.09,48.41 13.09,49.92 ; 18.22,45.44 19.55,45.44 19.87,45.11 U3.1 ; 18.22,45.44 17.97,45.19 U3.3
  Bottom Layer w0.508: v3(8.76,48.42) v3(13.08,48.42)
VIN: length 21.6
  Top Layer w0.762: U38.1 U38.2 71.38,56.52 v1(59.7,56.52) v1(59.32,56.13) P1.9
  Bottom Layer w0.762: v1(59.32,56.13) 59.74,56.56 61.22,56.56
  vias: v3(82.69,12.83)
VIN1:
  vias: v3(82.69,39.75)
(no net):
  vias: v1(23.24,49.85) v1(77.73,49.02) v2(2.79,53.76) v2(18.8,53.76)
BOOT0: length 3.6
  Top Layer w0.203: U1.94 44.02,34.8 v1(45.22,34.8)
  Bottom Layer w0.203: R16.1 v1(45.22,34.8)
BOOT1: length 2.3
  Top Layer w0.254: 55.41,26.95 54.49,27.87 v1(54.49,27.94)
  Bottom Layer w0.254: R22.1 54.21,28.42 54.21,28.22 v1(54.49,27.94)
BUS: length 18.1
  Top Layer w0.254: R1.2 3.81,32.16 CN1.1 ; U5.5 10.78,31.01 9.48,29.71 U5.8 9.48,27.68 v3(9.4,27.59)
  Bottom Layer w0.254: CN1.1 8.85,27.05 v3(9.4,27.59)
BUZZER: length 1.9
  Bottom Layer w0.254: U36.2 38.61,37.97 R8.1
FLASH_VCC: length 33.5
  Bottom Layer w0.254: R57.1 65.8,32.39 66.3,32.89 66.3,35.43 65.79,35.94 U37.7 ; U37.7 65.79,41.28 v1(67.06,42.55) U37.3 67.06,45.7 66.41,46.36 64.14,46.36 63.38,45.59 63.38,42.61 C17.1 v1(62.24,40.26) R45.2 ; U37.7 U37.8
  vias: v1(65.16,37.21)
KEY1: length 32.1
  Top Layer w0.203: SW3.1 SW3.2 ; v1(44.46,21.08) 44.46,25.26 U1.15
  Bottom Layer w0.254: v1(44.46,21.08) 44.46,8.51 42.3,6.35 39.25,6.35 v1(37.09,4.19)
KEY2: length 27.2
  Top Layer w0.203: U1.16 45.09,25.18 v1(45.09,21.84) ; SW4.1 SW4.2
  Bottom Layer w0.254: v1(45.09,21.84) 45.09,5.08 v1(45.98,4.19)
KEY3: length 32.6
  Top Layer w0.203: v1(45.73,22.35) 45.73,25.11 U1.17 ; SW5.4 57.02,4.12
  Bottom Layer w0.254: v1(54.87,4.19) 52.97,6.1 48.65,6.1 45.73,9.02 v1(45.73,22.35)
KEY4: length 40
  Top Layer w0.203: SW6.4 SW6.3
  Top Layer w0.254: U1.18 46.11,24.79 46.11,24.38 46.36,24.13 v1(46.36,22.86)
  Bottom Layer w0.254: v1(63.76,4.19) 60.33,7.62 48.9,7.62 46.36,10.16 v1(46.36,22.86)
LCD_DC: length 37.8
  Top Layer w0.254: U39.17 29.34,35.56 31.77,37.98 43.67,37.98 U1.90 45.71,35.94 51.32,35.94 v1(51.95,36.58)
  Bottom Layer w0.254: H1.6 52.46,44.07 52.46,40.13 53.09,39.5 53.09,37.72 v1(51.95,36.58)
LCD_RES: length 31.3
  Top Layer w0.254: v1(49.79,40.51) 46.52,37.24 45.82,37.24 U1.88 44.16,38.91 30.66,38.91 29.85,38.1 U39.15
  Bottom Layer w0.254: v1(49.79,40.51) 49.79,43.94 H1.5
LCD_SCL: length 33.8
  Top Layer w0.254: v1(48.27,37.97) 46.87,36.58 45.78,36.58 U1.89 43.92,38.44 31.46,38.44 29.85,36.83 27.57,36.83 U39.18
  Bottom Layer w0.254: v1(48.27,37.97) 48.27,46.74 H1.3
LCD_SDA: length 37
  Top Layer w0.254: U39.20 27.57,34.29 29.47,34.29 32.76,37.58 43.37,37.58 U1.91 45.76,35.18 v1(47.12,35.18)
  Bottom Layer w0.254: v1(47.12,35.18) 49.03,37.08 49.03,45.72 H1.4
LED1: length 42.7
  Top Layer w0.254: v1(30.87,56.9) v1(30.87,54.74) ; U39.10 27.57,46.99 v1(30.36,46.99) 35.37,41.98 46.03,41.98 U1.81
  Bottom Layer w0.254: R54.2 33.74,58.29 32.27,58.29 v1(30.87,56.9) ; v1(30.87,54.74) 30.87,47.5 v1(30.36,46.99)
LED2: length 39.4
  Top Layer w0.254: 48.98,41.87 47.03,43.81 39.25,43.81 30.99,52.07 27.57,52.07 ; v1(27.57,56.9) 27.57,52.07 ; 27.57,52.07 U39.6
  Bottom Layer w0.254: v1(27.57,56.9) 32.24,61.57 R53.2
MPU_INT: length 33.2
  Top Layer w0.254: U1.46 64.59,24.13 v1(69.48,24.13) 73.29,24.13 U38.27
  Bottom Layer w0.254: v1(69.48,24.13) 69.48,23.24 61.03,14.8 R31.1
MPU_SCL: length 28
  Top Layer w0.254: U38.26 64.27,25.4 v1(61.09,28.58) 60.85,28.58 U1.47
  Bottom Layer w0.254: v1(61.09,28.58) 61.09,21.93 R28.1 R30.2
MPU_SDA: length 32.8
  Top Layer w0.254: U38.25 73.29,26.67 64.14,26.67 v1(61.09,29.72) 60.42,29.72 U1.48
  Bottom Layer w0.254: v1(61.09,29.72) 57.03,25.65 57.03,21.16 R29.2 R27.1
MPU_VCC: length 31.1
  Top Layer w0.254: U32.8 55.63,11.42 55.25,11.05 55.25,10.41 55.76,9.91 57.92,9.91 59.66,11.65 59.66,12.79 ; 59.66,12.79 U32.13 ; 59.66,12.79 60.2,13.33 v1(60.2,16.13)
  Bottom Layer w0.254: R56.1 65.8,21.73 v1(60.2,16.13) 59,16.13 R28.2 57.09,18.03 53.76,18.03 R27.2
NRST: length 34.6
  Top Layer w0.254: RST.2 36.96,20.25 v1(36.59,19.88) 36.21,20.25 RST.1 ; 45.44,26.95 46.31,27.82 v1(46.31,27.83)
  Top Layer w0.508: v3(84.38,22.04) 88.45,17.97 U2.8
  Bottom Layer w0.254: R3#2.1 37.55,19.88 v1(36.59,19.88) 35.57,19.88 35.57,24.51 39.89,28.83 42.04,28.83 43.7,27.18 45.66,27.18 v1(46.31,27.83)
  Bottom Layer w0.508: U1#2.10 83.43,22.99 v3(84.38,22.04)
NRST1: length 7.6
  Top Layer w0.508: U4.9 86.71,49.85 v3(85.27,49.85)
  Bottom Layer w0.508: v3(85.27,49.85) 85.21,49.91 U3#2.10
OSC_IN: length 6.9
  Top Layer w0.254: v1(43.31,26.42) 43.5,26.42 U1.12
  Bottom Layer w0.254: X1.2 40.55,24.56 U2#2.1 42.4,26.42 v1(43.31,26.42)
OSC_OUT: length 6.9
  Top Layer w0.254: v1(43.82,25.91) 43.82,26.03 U1.13
  Bottom Layer w0.254: v1(43.82,25.91) 43.82,24.87 U3#3.1 41.97,23.01 X1.1
PA0: length 22.3
  Top Layer w0.254: U39.31 29.47,17.78 30.49,18.8 43.65,18.8 U1.23
PA1: length 26.1
  Top Layer w0.254: U1.24 42.84,17.27 30.36,17.27 29.6,16.51 27.57,16.51 U39.34
PA2: length 23.7
  Top Layer w0.254: U39.33 29.47,15.24 30.23,16 42.27,16 U1.25
PA3: length 30.8
  Top Layer w0.254: U39.36 27.69,14.1 43.95,14.1 52.04,22.18 52.04,22.54 U1.26
PA4: length 30.4
  Top Layer w0.254: U39.35 43.31,12.7 53.35,22.73 53.35,23.37 52.6,24.12 U1.29
PA5: length 35
  Top Layer w0.254: U1.30 53.86,23.55 53.86,22.61 42.68,11.43 27.57,11.43 U39.38
PA6: length 33.5
  Top Layer w0.254: U1.31 54.49,23.62 54.49,22.61 42.04,10.16 U39.37
PA7: length 38.2
  Top Layer w0.254: U39.40 27.57,8.89 41.54,8.89 55,22.35 55,23.82 U1.32
PA8: length 21.3
  Top Layer w0.203: U38.8 63.22,48.26 U1.67
PA9: length 35.1
  Top Layer w0.203: U38.7 73.41,49.4 63.51,49.4 v1(56.06,41.96) 56.06,41.81 U1.68 ; v1(52.97,50.67) 54.24,49.4 54.24,46.48 v1(55,45.72)
  Bottom Layer w0.203: v1(56.06,41.96) 56.06,44.66 v1(55,45.72)
PA10: length 30.7
  Top Layer w0.203: v1(56.78,48.77) 56.78,49.4 v1(55.51,50.67) ; U38.6 72.02,50.76 64.1,50.76 v1(56.78,43.43) 55,41.66 55,41.45 53.64,40.1
  Bottom Layer w0.203: v1(56.78,43.43) v1(56.78,48.77)
PA11: length 26.8
  Top Layer w0.203: U38.5 73.29,52.07 64.65,52.07 54.49,41.91 54.49,41.65 U1.70
PA12: length 26
  Top Layer w0.203: U1.71 53.98,41.85 53.98,42.16 56.78,44.96 56.78,47.62 57.79,48.64 60.46,48.64 65.16,53.34 U38.4
PA13: length 19.3
  Top Layer w0.254: U1.72 52.05,40.62 51.58,40.62 46.62,45.59 46.62,50.92 v1(47.89,52.2)
  Bottom Layer w0.254: P1.4 47.89,52.2
PA14: length 17.6
  Top Layer w0.254: v1(45.35,52.2) 44.08,50.93 44.08,45.85 45.35,44.58 46.97,44.58 U1.76
  Bottom Layer w0.254: P1.2 v1(45.35,52.2)
PB0: length 26.5
  Top Layer w0.254: U38.37 73.29,11.43 69.51,11.43 U1.35
PB1: length 22.7
  Top Layer w0.254: U1.36 68.7,12.95 71.76,12.95 U38.36
PB6: length 16.8
  Top Layer w0.254: U39.19 29.22,33.02 33.35,37.15 43.08,37.15 U1.92
PB7: length 19.8
  Top Layer w0.254: U1.93 42.78,36.75 34.34,36.75 29.34,31.75 27.57,31.75 U39.22
PB8: length 16.5
  Top Layer w0.254: U39.21 29.34,30.48 35.19,36.32 41.79,36.32 U1.95
PB9: length 19.6
  Top Layer w0.254: U39.24 27.57,29.21 29.34,29.21 36.02,35.88 41.52,35.88 42.26,35.15
PB12: length 27
  Top Layer w0.254: 60.01,33.73 65.8,27.94 U38.24
  Bottom Layer w0.254: v1(60.33,33.4) 60.33,35.95 R45.1 64.52,40.14 U37.1
PB13: length 22.5
  Top Layer w0.254: U38.23 73.29,29.21 66.81,29.21 v1(61.22,34.8) 60.36,34.8 U1.52
  Bottom Layer w0.254: v1(61.22,34.8) 65.29,34.8 R44.1
PB14: length 25.1
  Top Layer w0.254: U38.22 68.71,30.48 v1(63,36.19) 61.05,36.19 U1.53
  Bottom Layer w0.254: v1(63,36.19) 63.63,36.83 63.63,38.35 65.16,39.88 65.16,42.16 65.79,42.8 U37.2
PB15: length 25
  Top Layer w0.254: U1.54 61.11,36.96 63.63,36.96 v1(68.84,31.75) 73.41,31.75 74.56,30.61 U38.21
  Bottom Layer w0.254: v1(68.84,31.75) 68.84,34.92 68.33,35.43 U37.5
PC4: length 36.7
  Top Layer w0.254: U1.33 55.51,24.02 55.51,22.1 41.03,7.62 U39.39
PC5: length 24.2
  Top Layer w0.254: U38.38 70.08,10.16 U1.34
PC6: length 18.4
  Top Layer w0.254: U1.63 60.97,43.18 U38.12
PC7: length 22.2
  Top Layer w0.254: U38.11 73.29,44.45 61.53,44.45 55.41,38.33
PC8: length 19.9
  Top Layer w0.254: U1.65 62.09,45.72 U38.10
PC9: length 23.7
  Top Layer w0.254: U38.9 74.56,45.85 73.41,46.99 62.66,46.99 U1.66
PC10: length 23.6
  Top Layer w0.254: 48.62,41.51 46.78,43.35 38.19,43.35 30.74,50.8 U39.5
PC11: length 26
  Top Layer w0.254: U39.8 27.57,49.53 30.49,49.53 37.13,42.89 46.54,42.89 U1.79
PC12: length 22.2
  Top Layer w0.254: U39.7 29.09,48.01 30.61,48.01 36.19,42.43 46.29,42.43 U1.80
PC13: length 21.5
  Top Layer w0.254: U1.7 41.48,27.94 38.11,27.94 29.22,19.05 27.57,19.05 U39.32
PD1: length 20.7
  Top Layer w0.254: 47.21,40.1 45.77,41.54 34.66,41.54 30.49,45.72 U39.9
PD2: length 23
  Top Layer w0.254: U1.83 45.5,41.1 33.96,41.1 30.61,44.45 27.57,44.45 U39.12
PD3: length 19.2
  Top Layer w0.254: U39.11 30.74,43.18 33.24,40.68 45.21,40.68 U1.84
PD4: length 21.6
  Top Layer w0.254: U1.85 44.93,40.25 32.53,40.25 30.87,41.91 27.57,41.91 U39.14
PD5: length 17.8
  Top Layer w0.254: U1.86 44.66,39.82 31.69,39.82 30.87,40.64 U39.13
PD6: length 20.1
  Top Layer w0.254: U39.16 27.57,39.37 44.4,39.37 45.44,38.33
PD8: length 16.3
  Top Layer w0.254: U38.20 68.59,33.02 64.02,37.59 61.04,37.59 58.59,35.15
PD9: length 19.5
  Top Layer w0.254: U38.19 73.29,34.29 68.83,34.29 65.02,38.1 60.84,38.1 U1.56
PD10: length 16.5
  Top Layer w0.254: U38.18 68.46,35.56 65.41,38.61 60.64,38.61 U1.57
PD11: length 19.7
  Top Layer w0.254: U38.17 73.41,36.7 68.08,36.7 65.67,39.12 60.44,39.12 U1.58
PD12: length 16.7
  Top Layer w0.254: U38.16 67.44,38.1 65.92,39.62 60.24,39.62 U1.59
PD13: length 20.5
  Top Layer w0.254: U38.15 73.29,39.37 68.21,39.37 66.68,40.89 60.8,40.89 U1.60
PD14: length 17.6
  Top Layer w0.254: U38.14 68.46,40.64 67.7,41.4 60.6,41.4 U1.61
PD15: length 20.8
  Top Layer w0.254: U38.13 74.56,40.77 73.41,41.91 60.4,41.91 U1.62
PE0: length 16.4
  Top Layer w0.254: U39.23 29.6,27.94 37.09,35.43 41.27,35.43 U1.97
PE1: length 19.5
  Top Layer w0.254: U1.98 41,35 37.92,35 29.6,26.67 27.57,26.67 U39.26
PE2: length 14.6
  Top Layer w0.254: 40.85,31.54 40.42,31.11 35.82,31.11 30.11,25.4 U39.25
PE3: length 18.4
  Top Layer w0.254: U39.28 27.57,24.13 30.23,24.13 36.58,30.48 40.49,30.48 U1.2
PE4: length 16
  Top Layer w0.254: U1.3 40.56,29.84 36.96,29.84 29.98,22.86 U39.27
PE5: length 19.8
  Top Layer w0.254: U39.30 27.69,21.72 29.85,21.72 37.35,29.21 40.63,29.21 U1.4
PE6: length 28.4
  Top Layer w0.254: U39.29 29.47,20.32 37.73,28.58 40.7,28.58 U1.5 42.93,30.8 v1(42.93,31.24)
  Bottom Layer w0.254: v1(42.93,31.24) 42.55,31.62 39.63,31.62 38.61,32.65 U36.1
PE7: length 24.8
  Top Layer w0.254: U38.35 73.29,13.97 69.1,13.97 U1.38
PE8: length 21
  Top Layer w0.254: U38.34 68.53,15.24 U1.39
PE9: length 23.4
  Top Layer w0.254: U38.33 73.29,16.51 67.97,16.51 U1.40
PE10: length 19.6
  Top Layer w0.254: U38.32 67.41,17.78 56.83,28.36
PE11: length 21.9
  Top Layer w0.254: U38.31 73.29,19.05 66.84,19.05 U1.42
PE12: length 18.1
  Top Layer w0.254: U38.30 66.28,20.32 U1.43
PE13: length 20.4
  Top Layer w0.254: U38.29 73.29,21.59 65.72,21.59 U1.44
PE14: length 16.6
  Top Layer w0.254: U38.28 65.16,22.86 U1.45
RX:
  vias: v3(89.19,15.37)
RX1:
  vias: v3(89.19,42.29)
S_RX: length 22.1
  Top Layer w0.254: U6.4 12.73,24.64 U5.13 U5.2 12.7,34.23 12.7,41.59 13.56,42.45 U8.6
S_TX: length 30.9
  Top Layer w0.254: U8.7 13.56,43.72 11.94,42.1 11.94,37.12 10.13,35.31 U5.6 10.13,31.12 8.64,29.63 8.64,22.01 9.65,20.99 12.19,20.99 13.23,22.03 U6.3
SWCLK: length 7.6
  Top Layer w0.508: v3(84.38,20.52) U2.2
  Bottom Layer w0.508: v3(84.38,20.52) 86.86,22.99 U1#2.1
SWCLK1: length 10
  Top Layer w0.508: U4.3 84.44,44.83 v3(85.91,46.3)
  Bottom Layer w0.508: U3#2.1 87.11,49.91 85.91,48.71 v3(85.91,46.3)
SWDIO: length 7.6
  Top Layer w0.508: 82.66,23.06 84.89,23.06 v3(87.43,20.52)
  Bottom Layer w0.508: U1#2.2 87.5,20.45 v3(87.43,20.52)
SWDIO1: length 6.6
  Top Layer w0.508: v3(87.18,47.44) 82.76,47.44 U4.2
  Bottom Layer w0.508: v3(87.18,47.44) 89.12,47.44 U3#2.2
TX:
  vias: v3(89.16,12.89)
TX1: length 8.5
  Top Layer w0.508: U4.8 88.13,44.83 86.54,43.25 v3(86.54,41.34)
  Bottom Layer w0.508: v3(86.54,41.34) 88.13,39.75 U3#2.5
USB_DN: length 11
  Top Layer w0.254: 11,47.71 11.84,46.87 11.84,44.7 11.34,44.21 10.39,44.21 9.91,43.72 U8.2 ; 11,47.71 11.42,48.13 USB1.B7 ; 11,47.71 10.37,48.34 10.37,48.99 10.42,49.04 USB1.A7
USB_DP: length 11
  Top Layer w0.254: USB1.A6 10.92,50.71 10.67,50.96 10.16,50.96 9.92,50.72 USB1.B6 9.92,49.04 9.96,48.99 9.96,48.17 11.43,46.7 11.43,44.87 11.18,44.61 10.29,44.61 9.91,44.99 U8.1
$1N348: length 6.1
  Top Layer w0.254: U5.10 v3(10.78,29.88) ; U5.3 12.08,32.56 v3(12.06,32.55)
  Bottom Layer w0.254: v3(12.06,32.55) 12.06,31.17 v3(10.78,29.88)
$1N351: length 9.7
  Top Layer w0.254: U5.11 U5.4 v3(11.43,35.47) ; R2.1 10.67,37.88 v3(11.18,37.37)
  Bottom Layer w0.254: v3(11.43,35.47) 11.43,37.12 v3(11.18,37.37)
$1N1470: length 2.3
  Top Layer w0.508: R3.2 19.18,29.75 LED1.2
$1N1496: length 2
  Top Layer w0.254: R4.2 3.8,49.68 LED2.2
$1N1608: length 11.7
  Top Layer w0.254: v1(51.32,28.45) 51.32,27.87 U1.21
  Bottom Layer w0.254: U4#2.2 49.96,29.81 v1(51.32,28.45) ; U5#2.2 49.96,32.37
$1N1611: length 2.3
  Top Layer w0.254: U1.49 60.36,30.48 v1(60.59,30.48)
  Bottom Layer w0.254: 61.35,31.27 61.35,31.24 v1(60.59,30.48)
$1N1612: length 2.5
  Top Layer w0.254: 52.23,41.51 53.47,42.76 v1(53.47,42.8)
  Bottom Layer w0.254: 53.99,43.19 53.87,43.19 v1(53.47,42.8)
$1N2522: length 3.8
  Bottom Layer w0.254: 52.97,52.32 P1.8
$1N2523: length 3.8
  Bottom Layer w0.254: 55.5,52.35 55.5,53.47 55.51,53.47 P1.10
$1N6488: length 1.5
  Top Layer w0.254: v1(55,16.89) 55.13,16.76 U32.24
  Bottom Layer w0.254: R29.1 55,16.83
$1N6489: length 1.5
  Top Layer w0.254: v1(55.76,16.89) 55.63,16.76 U32.23
  Bottom Layer w0.254: R30.1 56.09,17.23 v1(55.76,16.89)
$1N6494: length 3.1
  Top Layer w0.254: U32.12 58.24,12.04 v1(58.27,12.06)
  Bottom Layer w0.254: v1(58.27,12.06) 59.44,12.06 59.68,12.3 R31.2
$1N6499: length 2.3
  Top Layer w0.254: U32.9 56.13,10.91 v1(55.89,10.67)
  Bottom Layer w0.254: R32.2 55.15,10.67 v1(55.89,10.67)
$1N6502: length 2.6
  Top Layer w0.254: U32.10 56.63,11.52 57.09,11.05 v1(57.54,11.05)
  Bottom Layer w0.254: U33.1 57.91,11.05 v1(57.54,11.05)
$1N6503: length 3.3
  Top Layer w0.254: v1(59.06,17.14) 57.79,17.14 57.13,16.48 U32.20
  Bottom Layer w0.254: v1(59.06,17.14) 59.55,17.14 U34.2
$1N11456: length 2.7
  Bottom Layer w0.254: R44.2 67.06,34.55 U37.6
$1N14653: length 6.4
  Bottom Layer w0.254: D2.2 35.98,42.4 Q3.3 32.47,42.96 BUZZER1.2
$1N14654: length 3.3
  Bottom Layer w0.254: Q3.1 36.58,40.4 R8.2
$1N14984: length 0.6
  Top Layer w0.203: LED2#2.2 64.35,59.97 v1(64.35,59.7)
  Bottom Layer w0.203: v1(64.35,59.7) R47.1
$1N15262: length 0.8
  Top Layer w0.203: LED5.2 67.91,59.97 v1(67.91,59.63)
  Bottom Layer w0.203: v1(67.91,59.63) R50.1
$1N15508: length 0.9
  Top Layer w0.203: v1(32.77,59.58) 32.77,59.97 LED8.2
  Bottom Layer w0.203: v1(32.77,59.58) R53.1
$1N19842: length 0.9
  Top Layer w0.203: v1(36.96,59.56) LED9.2
  Bottom Layer w0.203: v1(36.96,59.56) 37.02,59.62 R54.1
$1N50866: length 2
  Bottom Layer w0.254: R12.1 67.45,51.93 U40.3

## Copper pours and planes (outline as drawn; the poured copper is in the pictures)
5V on Bottom Layer: 59.51,57.28 64.9,57.28 64.9,50.89 59.51,50.89
GND on Top Layer: -20.06,88.14 113.93,88.14 113.93,-19.18 -20.06,-19.18
GND on Bottom Layer: -4.31,75.31 98.94,75.31 98.94,-42.29 -4.31,-42.29
PVCC on Top Layer: 0.51,39.9 5.97,39.9 5.97,33.94 0.51,33.94
PVCC on Bottom Layer: 0.51,37.75 5.97,37.75 5.97,23.15 0.51,23.15

Small or netless copper shapes (teardrops, artwork), in the pictures only: 285 on Top Layer, 217 on Bottom Layer

## Text on the board
Bottom Silkscreen Layer: FLASH | SPI-FLASH | 陀螺仪 | BUZZER | ENABLE | Ver1.0.69 | 通信方式：串口 | 输入电压：6V~8.4V | 总线舵机控制板 | 5V | RST | N | G | 3V3 | SD | RX | TX | SC
Top Silkscreen Layer: DO | CK | 3V3 | 5V | G | N | RST | TX | RX | - | + | PC11 | PA15 | PD0 | PC13 | PB9 | PD6 | PD4 | PB5 | PE1 | PB3 | PB7 | PD2 | PA5 | PE3 | PA1 | PA3 | PE5 | PA7 | PC12 | PC10 | PD1 | PE2 | PD3 | PA0 | PA2 | PA4 | PD5 | PD7 | PB4 | PB6 | PB8 | PE0 | PE4 | PE6 | PA6 | PC4 | PD14 | PA12 | PA10 | PD12 | PD10 | PB14 | PB12 | PA8 | PC8 | PC6 | PD8 | PB10 | PE14 | PE12 | PE10 | GND | PE8 | PB1 | PC5 | PE13 | PA11 | PD15 | PD13 | PD11 | PB15 | PB13 | PE11 | PA9 | PC7 | PD9 | PB11 | PE15 | PE9 | PE7 | PB0 | LED1 | LED2 | MPU6050 | Cortex®-M4 | BUS | P | KEY1 | KEY2 | KEY3 | KEY4 | STM32F407
